# Altium schematic sheet 02.C214. A01-A16, A17. Module BASU Stoper VN_HN.SchDoc: Кабель стопора
size 209 x 297 mm; Author: Мурашкин Д.В.; Address1: Address1; Address2: Address2; Address3: Address3; Address4: Address4; DocumentNumber: ИЗДЕЛИЕ-1-2; SheetNumber: 25; Scale: 1:1; Letter1Column: Э
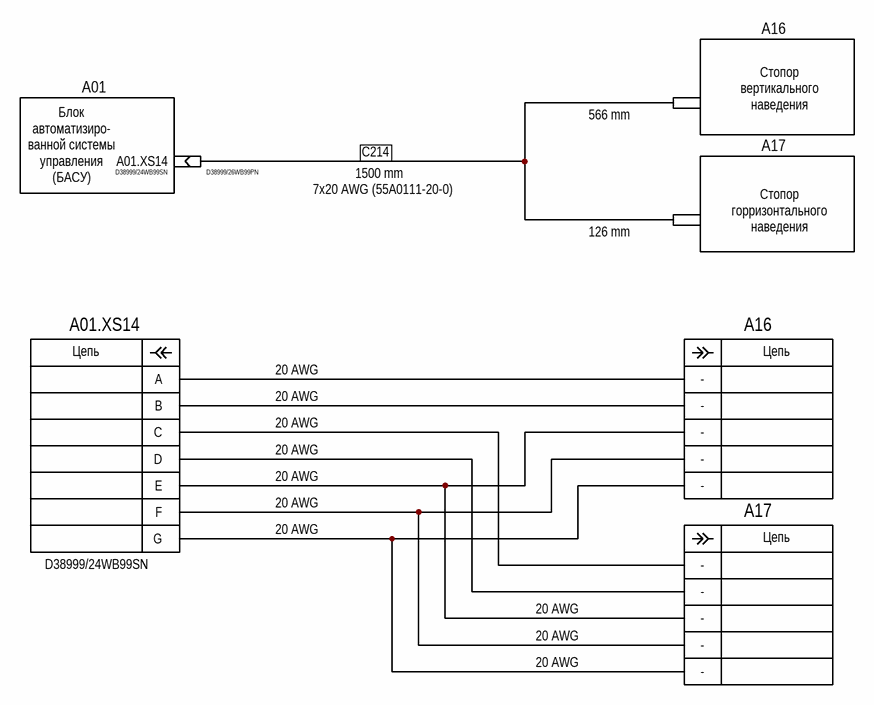
[diagram p0: 02.C214. A01-A16, A17. Module BASU Stoper VN_HN.SchDoc]

## Parts
(Parts that share a designator on the sheet are numbered #1, #2 ... from top to bottom, then left to right.)
A01.XS14#1  D38999/24WB99SN
A01.XS14#2  D38999/24WB99SN
A16  (no value)
A17  (no value)
A?#1  Провод  (value not drawn)  (no BOM)
A?#2  D38999/26WB99PN
A?#3  Провод  (value not drawn)  (no BOM)

## Nets
С214: A?#1.0 A?#2.0 A?#3.0
NetA01.XS14#2_A: A01.XS14#2.A A16.-
NetA01.XS14#2_B: A01.XS14#2.B A16.-
NetA01.XS14#2_C: A01.XS14#2.C A17.-
NetA01.XS14#2_D: A01.XS14#2.D A17.-
NetA01.XS14#2_E: A01.XS14#2.E A16.- A17.-
NetA01.XS14#2_F: A01.XS14#2.F A16.- A17.-
NetA01.XS14#2_G: A01.XS14#2.G A16.- A17.-

Not connected (* = marked no-connect by the designer): A01.XS14#1 0

## Notes on the sheet
- A01
- A16
- (near A?#1) 566 mm
- (near A?#1) Стопор вертикального наведения
- A17
- Блок автоматизиро- ванной системы управления (БАСУ)
- 7x20 AWG (55A0111-20-0)
- 1500 mm
- (near A?#3) 126 mm
- (near A?#3) Стопор горризонтального наведения
- 20 AWG
- Перв. примен.
- Справ. №
- Подп. и дата
- Инв. № дубл.
- Взам. инв. №
- Инв. № подл.
- Изм.
- Лист
- № докум.
- Подп.
- Дата
- 2.106-A4
- Копировал
- Формат А4
- (in symbol Connector signal P7) Цепь
- (in symbol P5 MIL _color) Цепь

## Library data of the parts
A01.XS14#1 = Connector cable socket: Part name: D38999/24WB99SN; Operating temperature: -°C +°C; Mounting type: Surface mount; Dimension: .0mm x .0mm; Height: .0mm
A01.XS14#2 = Connector signal P7: P7 MIL; Operating temperature: -°C +°C; Mounting type: Surface mount; Dimension: .0mm x .0mm; Height: .0mm
A16 A17 = P5 MIL _color: Operating temperature: -°C +°C; Mounting type: Surface mount; Dimension: .0mm x .0mm; Height: .0mm
A?#1 A?#3 = Connector cable coupling: Operating temperature: -°C +°C; Mounting type: Surface mount; Dimension: .0mm x .0mm; Height: .0mm
A?#2 = Connector cable plug: Part name: D38999/26WB99PN; Operating temperature: -°C +°C; Mounting type: Surface mount; Dimension: .0mm x .0mm; Height: .0mm